# Altium project R2.PrjPcb
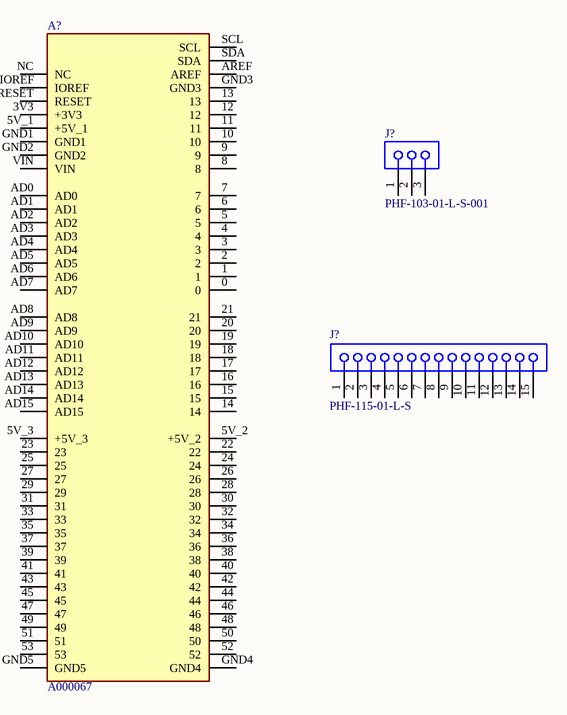
[diagram p0: schematic.SchDoc]
1 sheet, 3 parts. Net scope: global (net labels, ports and power ports of the same name join across sheets).
Board file: pcb.PcbDoc

## Sheet schematic.SchDoc
size A4; SheetNumber: 1; SheetTotal: 1

### Parts
(Parts that share a designator on the sheet are numbered #1, #2 ... from top to bottom, then left to right.)
A?  A000067  [PCBComponent_1]
J?#1  PHF-103-01-L-S-001  [SMTC-PHF-103-01-X-S-001]
J?#2  PHF-115-01-L-S  [SMTC-PHF-115-01-X-S]

### Nets

Not connected (* = marked no-connect by the designer): A? 0 1 2 3 3V3(+3V3) 4 5 5V_1(+5V_1) 5V_2(+5V_2) 5V_3(+5V_3) 6 7 8 9 10 11 12 13 14 15 16 17 18 19 20 21 22 23 24 25 26 27 28 29 30 31 32 33 34 35 36 37 38 39 40 41 42 43 44 45 46 47 48 49 50 51 52 53 AD0 AD1 AD2 AD3 AD4 AD5 AD6 AD7 AD8 AD9 AD10 AD11 AD12 AD13 AD14 AD15 AREF GND1 GND2 GND3 GND4 GND5 IOREF NC RESET SCL SDA VIN; J?#1 1 2 3; J?#2 1 2 3 4 5 6 7 8 9 10 11 12 13 14 15

### Library data of the parts
A? = A000067: Arduino Mega 2560 Rev3 Microcontroller Board, ATmega2560 | Arduino A000067; SnapEDA_Link: https://www.snapeda.com/parts/A000067/Arduino/view-part/?ref=snap; Package: Non-Standard Arduino; Value: *; MF: Arduino; MP: A000067; Check_prices: https://www.snapeda.com/parts/A000067/Arduino/view-part/?ref=eda
J?#1 = CMP-1023-00107-1: Press Fit Socket, Through-hole, Vertical, -55 to 125 degC, 2.54 mm Pitch, 3-Pin, Female, RoHS; Manufacturer: Samtec; Pitch: 2.54 mm; PackageVersion: F, 9/2009; RoHS: True; ComponentLink2URL: http://www.samtec.com/documents/webfiles/pdf/phf.pdf; Temperature Range: -55 to 125 degC; PartNumber: PHF-103-01-L-S-001; PackageReference: PHF-103-01-X-S-001; DatasheetVersion: F-214; ComponentLink1URL: http://www.samtec.com; Orientation: Vertical; Mounting Technology: Through-hole; ComponentLink2Description: Datasheet; ComponentLink3Description: Package Specification; PackageDescription: .100 Press Fit Socket Assembly; ComponentLink1Description: Manufacturer URL; ComponentLink3URL: http://www.samtec.com/documents/webfiles/cpdf/PHF-1XX-XX-X-X-XXX-MKT.pdf
J?#2 = CMP-1023-00117-1: Press Fit Socket, Through-hole, Vertical, -55 to 125 degC, 2.54 mm Pitch, 15-Pin, Female, RoHS; Manufacturer: Samtec; Pitch: 2.54 mm; ComponentLink2Description: Datasheet; Orientation: Vertical; ComponentLink3URL: http://www.samtec.com/documents/webfiles/cpdf/PHF-1XX-XX-X-X-XXX-MKT.pdf; Mounting Technology: Through-hole; PartNumber: PHF-115-01-L-S; DatasheetVersion: F-214; PackageVersion: F, 9/2009; ComponentLink1Description: Manufacturer URL; RoHS: True; Temperature Range: -55 to 125 degC; PackageDescription: .100 Press Fit Socket Assembly; ComponentLink2URL: http://www.samtec.com/documents/webfiles/pdf/phf.pdf; ComponentLink1URL: http://www.samtec.com; PackageReference: PHF-115-01-X-S; ComponentLink3Description: Package Specification